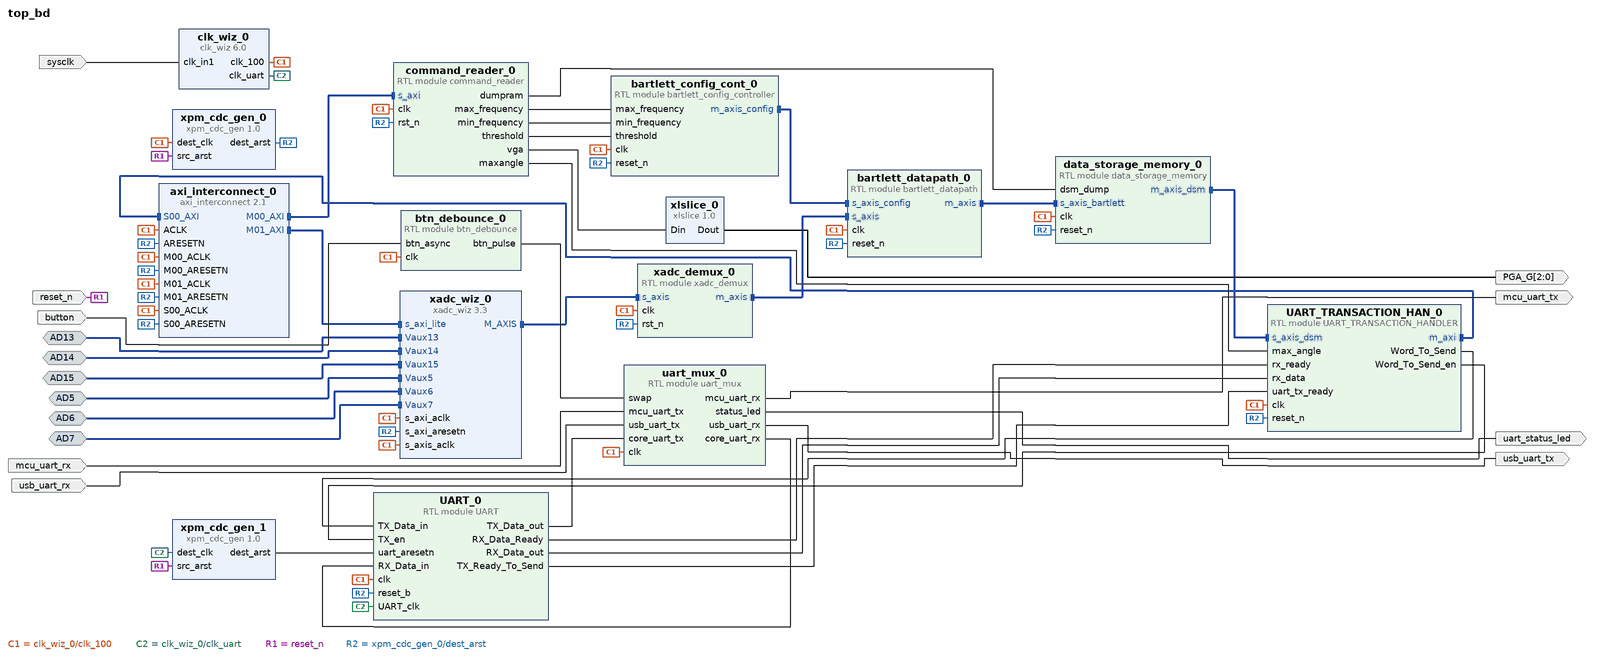
[diagram p0: block diagram of the top level]
# Vivado block design top_bd, xc7a35tcpg236-1, Vivado 2022.2
create_bd_design top_bd

create_bd_intf_port -mode Slave -vlnv xilinx.com:interface:diff_analog_io_rtl:1.0 AD5
create_bd_intf_port -mode Slave -vlnv xilinx.com:interface:diff_analog_io_rtl:1.0 AD13
create_bd_intf_port -mode Slave -vlnv xilinx.com:interface:diff_analog_io_rtl:1.0 AD14
create_bd_intf_port -mode Slave -vlnv xilinx.com:interface:diff_analog_io_rtl:1.0 AD15
create_bd_intf_port -mode Slave -vlnv xilinx.com:interface:diff_analog_io_rtl:1.0 AD7
create_bd_intf_port -mode Slave -vlnv xilinx.com:interface:diff_analog_io_rtl:1.0 AD6
create_bd_port -dir I -type rst reset_n
set_property -dict {CONFIG.POLARITY ACTIVE_HIGH} [get_bd_ports reset_n]
create_bd_port -dir I -type clk sysclk
set_property -dict {CONFIG.FREQ_HZ 12000000 CONFIG.PHASE 0.0} [get_bd_ports sysclk]
create_bd_port -dir O mcu_uart_tx
create_bd_port -dir I mcu_uart_rx
create_bd_port -dir O -from 2 -to 0 PGA_G
create_bd_port -dir I button
create_bd_port -dir I usb_uart_rx
create_bd_port -dir O usb_uart_tx
create_bd_port -dir O uart_status_led

create_bd_cell -type ip -vlnv xilinx.com:ip:xpm_cdc_gen:1.0 xpm_cdc_gen_0
set_property -dict {CONFIG.CDC_TYPE xpm_cdc_async_rst CONFIG.DEST_SYNC_FF 3 CONFIG.INIT_SYNC_FF true} [get_bd_cells xpm_cdc_gen_0]
create_bd_cell -type ip -vlnv xilinx.com:ip:xadc_wiz:3.3 xadc_wiz_0
set_property -dict [list \
  CONFIG.CHANNEL_ENABLE_VAUXP13_VAUXN13 true \
  CONFIG.CHANNEL_ENABLE_VAUXP14_VAUXN14 true \
  CONFIG.CHANNEL_ENABLE_VAUXP15_VAUXN15 true \
  CONFIG.CHANNEL_ENABLE_VAUXP5_VAUXN5 true \
  CONFIG.CHANNEL_ENABLE_VAUXP6_VAUXN6 true \
  CONFIG.CHANNEL_ENABLE_VAUXP7_VAUXN7 true \
  CONFIG.CHANNEL_ENABLE_VP_VN false \
  CONFIG.ENABLE_AXI4STREAM true \
  CONFIG.ENABLE_CALIBRATION_AVERAGING false \
  CONFIG.OT_ALARM false \
  CONFIG.SEQUENCER_MODE Off \
  CONFIG.USER_TEMP_ALARM false \
  CONFIG.VCCAUX_ALARM false \
  CONFIG.VCCINT_ALARM false \
  CONFIG.XADC_STARUP_SELECTION simultaneous_sampling \
] [get_bd_cells xadc_wiz_0]
create_bd_cell -type ip -vlnv xilinx.com:ip:axi_interconnect:2.1 axi_interconnect_0
set_property -dict [list \
  CONFIG.ENABLE_ADVANCED_OPTIONS 1 \
  CONFIG.NUM_MI 2 \
  CONFIG.NUM_SI 1 \
  CONFIG.S00_HAS_DATA_FIFO 2 \
  CONFIG.S01_HAS_DATA_FIFO 2 \
  CONFIG.STRATEGY 0 \
] [get_bd_cells axi_interconnect_0]
create_bd_cell -type ip -vlnv xilinx.com:ip:xpm_cdc_gen:1.0 xpm_cdc_gen_1
set_property -dict {CONFIG.CDC_TYPE xpm_cdc_async_rst CONFIG.DEST_SYNC_FF 3 CONFIG.INIT_SYNC_FF true} [get_bd_cells xpm_cdc_gen_1]
create_bd_cell -type ip -vlnv xilinx.com:ip:clk_wiz:6.0 clk_wiz_0
set_property -dict [list \
  CONFIG.CLKOUT1_JITTER 521.509 \
  CONFIG.CLKOUT1_PHASE_ERROR 635.708 \
  CONFIG.CLKOUT2_JITTER 856.669 \
  CONFIG.CLKOUT2_PHASE_ERROR 635.708 \
  CONFIG.CLKOUT2_REQUESTED_OUT_FREQ 5.76 \
  CONFIG.CLKOUT2_USED true \
  CONFIG.CLK_IN1_BOARD_INTERFACE sys_clock \
  CONFIG.CLK_OUT1_PORT clk_100 \
  CONFIG.CLK_OUT2_PORT clk_uart \
  CONFIG.MMCM_CLKFBOUT_MULT_F 56.250 \
  CONFIG.MMCM_CLKOUT0_DIVIDE_F 6.750 \
  CONFIG.MMCM_CLKOUT1_DIVIDE 117 \
  CONFIG.NUM_OUT_CLKS 2 \
  CONFIG.USE_BOARD_FLOW true \
  CONFIG.USE_LOCKED false \
  CONFIG.USE_RESET false \
] [get_bd_cells clk_wiz_0]
create_bd_cell -type module -reference command_reader command_reader_0
create_bd_cell -type module -reference UART UART_0
create_bd_cell -type module -reference xadc_demux xadc_demux_0
create_bd_cell -type module -reference bartlett_config_controller bartlett_config_cont_0
create_bd_cell -type module -reference UART_TRANSACTION_HANDLER UART_TRANSACTION_HAN_0
set_property -dict {CONFIG.DSM_TDATA_WIDTH 48} [get_bd_cells UART_TRANSACTION_HAN_0]
create_bd_cell -type module -reference data_storage_memory data_storage_memory_0
create_bd_cell -type module -reference bartlett_datapath bartlett_datapath_0
set_property -dict {CONFIG.THETA_WIDTH 16} [get_bd_cells bartlett_datapath_0]
create_bd_cell -type module -reference btn_debounce btn_debounce_0
set_property -dict {CONFIG.G_PULSE_EDGE 0 CONFIG.G_PULSE_ENABLED true} [get_bd_cells btn_debounce_0]
create_bd_cell -type ip -vlnv xilinx.com:ip:xlslice:1.0 xlslice_0
set_property -dict {CONFIG.DIN_FROM 2} [get_bd_cells xlslice_0]
create_bd_cell -type module -reference uart_mux uart_mux_0

# ---- connections ----

connect_bd_intf_net -intf_net AD13_1 [get_bd_intf_ports AD13] [get_bd_intf_pins xadc_wiz_0/Vaux13]
connect_bd_intf_net -intf_net AD14_1 [get_bd_intf_ports AD14] [get_bd_intf_pins xadc_wiz_0/Vaux14]
connect_bd_intf_net -intf_net AD15_1 [get_bd_intf_ports AD15] [get_bd_intf_pins xadc_wiz_0/Vaux15]
connect_bd_intf_net -intf_net AD5_1 [get_bd_intf_ports AD5] [get_bd_intf_pins xadc_wiz_0/Vaux5]
connect_bd_intf_net -intf_net AD6_1 [get_bd_intf_ports AD6] [get_bd_intf_pins xadc_wiz_0/Vaux6]
connect_bd_intf_net -intf_net AD7_1 [get_bd_intf_ports AD7] [get_bd_intf_pins xadc_wiz_0/Vaux7]
connect_bd_intf_net [get_bd_intf_pins UART_TRANSACTION_HAN_0/m_axi] [get_bd_intf_pins axi_interconnect_0/S00_AXI]
connect_bd_intf_net [get_bd_intf_pins axi_interconnect_0/M00_AXI] [get_bd_intf_pins command_reader_0/s_axi]
connect_bd_intf_net [get_bd_intf_pins axi_interconnect_0/M01_AXI] [get_bd_intf_pins xadc_wiz_0/s_axi_lite]
connect_bd_intf_net [get_bd_intf_pins bartlett_config_cont_0/m_axis_config] [get_bd_intf_pins bartlett_datapath_0/s_axis_config]
connect_bd_intf_net [get_bd_intf_pins bartlett_datapath_0/m_axis] [get_bd_intf_pins data_storage_memory_0/s_axis_bartlett]
connect_bd_intf_net [get_bd_intf_pins data_storage_memory_0/m_axis_dsm] [get_bd_intf_pins UART_TRANSACTION_HAN_0/s_axis_dsm]
connect_bd_intf_net [get_bd_intf_pins xadc_demux_0/m_axis] [get_bd_intf_pins bartlett_datapath_0/s_axis]
connect_bd_intf_net [get_bd_intf_pins xadc_wiz_0/M_AXIS] [get_bd_intf_pins xadc_demux_0/s_axis]
connect_bd_net [get_bd_pins UART_0/RX_Data_Ready] [get_bd_pins UART_TRANSACTION_HAN_0/rx_ready]
connect_bd_net [get_bd_pins UART_0/RX_Data_out] [get_bd_pins UART_TRANSACTION_HAN_0/rx_data]
connect_bd_net [get_bd_pins UART_0/TX_Data_out] [get_bd_pins uart_mux_0/core_uart_tx]
connect_bd_net [get_bd_pins UART_0/TX_Ready_To_Send] [get_bd_pins UART_TRANSACTION_HAN_0/uart_tx_ready]
connect_bd_net [get_bd_pins UART_TRANSACTION_HAN_0/Word_To_Send] [get_bd_pins UART_0/TX_Data_in]
connect_bd_net [get_bd_pins UART_TRANSACTION_HAN_0/Word_To_Send_en] [get_bd_pins UART_0/TX_en]
connect_bd_net [get_bd_pins btn_debounce_0/btn_pulse] [get_bd_pins uart_mux_0/swap]
connect_bd_net [get_bd_ports button] [get_bd_pins btn_debounce_0/btn_async]
connect_bd_net [get_bd_pins clk_wiz_0/clk_100] \
  [get_bd_pins xpm_cdc_gen_0/dest_clk] [get_bd_pins xadc_wiz_0/s_axis_aclk] [get_bd_pins xadc_wiz_0/s_axi_aclk] \
  [get_bd_pins axi_interconnect_0/ACLK] [get_bd_pins axi_interconnect_0/M01_ACLK] [get_bd_pins axi_interconnect_0/M00_ACLK] \
  [get_bd_pins axi_interconnect_0/S00_ACLK] [get_bd_pins command_reader_0/clk] [get_bd_pins UART_0/clk] \
  [get_bd_pins xadc_demux_0/clk] [get_bd_pins bartlett_config_cont_0/clk] [get_bd_pins UART_TRANSACTION_HAN_0/clk] \
  [get_bd_pins data_storage_memory_0/clk] [get_bd_pins bartlett_datapath_0/clk] [get_bd_pins btn_debounce_0/clk] \
  [get_bd_pins uart_mux_0/clk]
connect_bd_net [get_bd_pins clk_wiz_0/clk_uart] [get_bd_pins xpm_cdc_gen_1/dest_clk] [get_bd_pins UART_0/UART_clk]
connect_bd_net [get_bd_pins command_reader_0/dumpram] [get_bd_pins data_storage_memory_0/dsm_dump]
connect_bd_net [get_bd_pins command_reader_0/max_frequency] [get_bd_pins bartlett_config_cont_0/max_frequency]
connect_bd_net [get_bd_pins command_reader_0/maxangle] [get_bd_pins UART_TRANSACTION_HAN_0/max_angle]
connect_bd_net [get_bd_pins command_reader_0/min_frequency] [get_bd_pins bartlett_config_cont_0/min_frequency]
connect_bd_net [get_bd_pins command_reader_0/threshold] [get_bd_pins bartlett_config_cont_0/threshold]
connect_bd_net [get_bd_pins command_reader_0/vga] [get_bd_pins xlslice_0/Din]
connect_bd_net [get_bd_ports mcu_uart_rx] [get_bd_pins uart_mux_0/mcu_uart_tx]
connect_bd_net [get_bd_ports reset_n] [get_bd_pins xpm_cdc_gen_0/src_arst] [get_bd_pins xpm_cdc_gen_1/src_arst]
connect_bd_net [get_bd_ports sysclk] [get_bd_pins clk_wiz_0/clk_in1]
connect_bd_net [get_bd_pins uart_mux_0/core_uart_rx] [get_bd_pins UART_0/RX_Data_in]
connect_bd_net [get_bd_pins uart_mux_0/mcu_uart_rx] [get_bd_ports mcu_uart_tx]
connect_bd_net [get_bd_pins uart_mux_0/status_led] [get_bd_ports uart_status_led]
connect_bd_net [get_bd_pins uart_mux_0/usb_uart_rx] [get_bd_ports usb_uart_tx]
connect_bd_net [get_bd_ports usb_uart_rx] [get_bd_pins uart_mux_0/usb_uart_tx]
connect_bd_net [get_bd_pins xlslice_0/Dout] [get_bd_ports PGA_G]
connect_bd_net [get_bd_pins xpm_cdc_gen_0/dest_arst] \
  [get_bd_pins xadc_wiz_0/s_axi_aresetn] [get_bd_pins axi_interconnect_0/ARESETN] \
  [get_bd_pins axi_interconnect_0/M00_ARESETN] [get_bd_pins axi_interconnect_0/M01_ARESETN] \
  [get_bd_pins axi_interconnect_0/S00_ARESETN] [get_bd_pins command_reader_0/rst_n] [get_bd_pins UART_0/reset_b] \
  [get_bd_pins xadc_demux_0/rst_n] [get_bd_pins bartlett_config_cont_0/reset_n] [get_bd_pins UART_TRANSACTION_HAN_0/reset_n] \
  [get_bd_pins data_storage_memory_0/reset_n] [get_bd_pins bartlett_datapath_0/reset_n]
connect_bd_net [get_bd_pins xpm_cdc_gen_1/dest_arst] [get_bd_pins UART_0/uart_aresetn]

# ---- address map ----
assign_bd_address -offset 0x00000000 -range 512 -target_address_space [get_bd_addr_spaces UART_TRANSACTION_HAN_0/m_axi] [get_bd_addr_segs command_reader_0/s_axi/reg0]
assign_bd_address -offset 0x00010000 -range 1K -target_address_space [get_bd_addr_spaces UART_TRANSACTION_HAN_0/m_axi] [get_bd_addr_segs xadc_wiz_0/s_axi_lite/Reg]

validate_bd_design
save_bd_design
